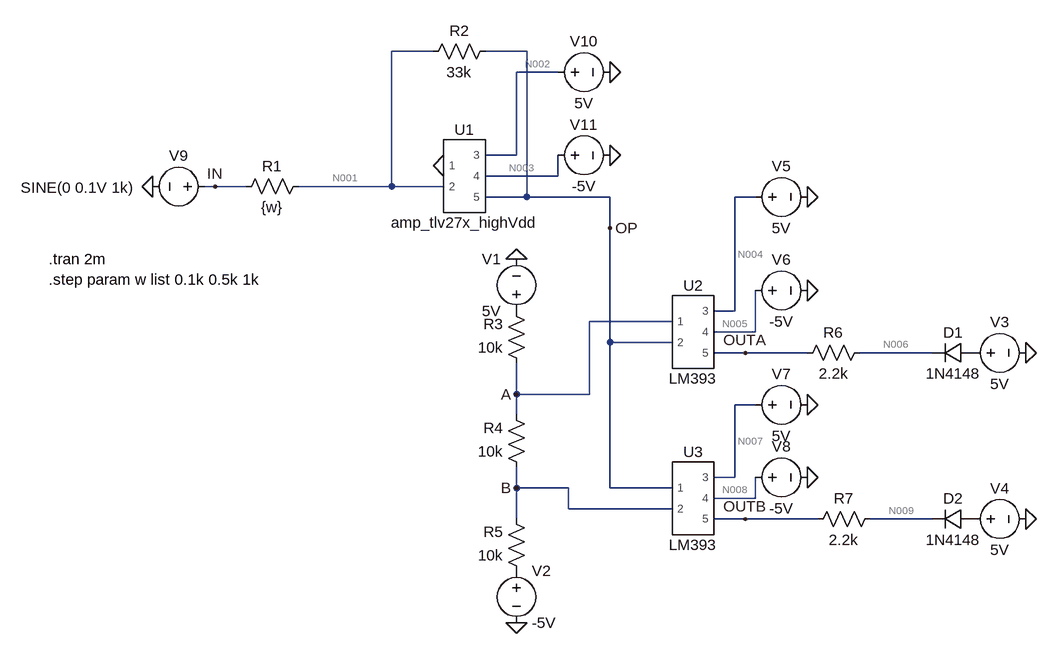
[diagram p0: schematic Example-7-8-a.asc]
Example-7-8-a.asc, the LTspice schematic file:
Version 4.1
SHEET 1 880 920
WIRE -64 0 -128 0
WIRE 80 0 16 0
WIRE 128 32 64 32
WIRE 64 160 64 32
WIRE 64 160 16 160
WIRE 128 192 128 160
WIRE 128 192 16 192
WIRE -400 208 -416 208
WIRE -352 208 -400 208
WIRE -128 208 -128 0
WIRE -128 208 -272 208
WIRE -48 208 -128 208
WIRE 80 224 80 0
WIRE 80 224 16 224
WIRE 208 224 80 224
WIRE 432 224 400 224
WIRE 208 272 208 224
WIRE 400 400 400 224
WIRE 400 400 368 400
WIRE 304 416 176 416
WIRE 432 432 432 368
WIRE 432 432 368 432
WIRE 208 448 208 272
WIRE 304 448 208 448
WIRE 416 464 368 464
WIRE 512 464 416 464
WIRE 704 464 592 464
WIRE 64 528 64 480
WIRE 176 528 176 416
WIRE 176 528 64 528
WIRE 432 544 400 544
WIRE 64 560 64 528
WIRE 400 656 400 544
WIRE 400 656 368 656
WIRE 64 672 64 640
WIRE 144 672 64 672
WIRE 208 672 208 448
WIRE 304 672 208 672
WIRE 432 688 432 656
WIRE 432 688 368 688
WIRE 144 704 144 672
WIRE 304 704 144 704
WIRE 64 720 64 672
WIRE 416 720 368 720
WIRE 528 720 416 720
WIRE 704 720 608 720
FLAG -48 176 0
FLAG 64 320 0
FLAG 512 224 0
FLAG 512 368 0
FLAG 64 880 0
FLAG 848 720 0
FLAG 848 464 0
FLAG -496 208 0
FLAG 512 544 0
FLAG 512 656 0
FLAG 208 32 0
FLAG 208 160 0
FLAG -400 208 IN
FLAG 64 528 A
FLAG 64 672 B
FLAG 416 464 OUTA
FLAG 416 720 OUTB
FLAG 208 272 OP
SYMBOL EEL3111C\\amp_tlv27x_highVdd -16 192 R0
SYMATTR InstName U1
SYMBOL EEL3111C\\LM393 336 432 R0
SYMATTR InstName U2
SYMBOL EEL3111C\\LM393 336 688 R0
SYMATTR InstName U3
SYMBOL res -256 192 R90
WINDOW 0 0 56 VBottom 2
WINDOW 3 32 56 VTop 2
SYMATTR InstName R1
SYMATTR Value {w}
SYMBOL res 32 -16 R90
WINDOW 0 0 56 VBottom 2
WINDOW 3 32 56 VTop 2
SYMATTR InstName R2
SYMATTR Value 33k
SYMBOL res 80 496 R180
WINDOW 0 36 76 Left 2
WINDOW 3 36 40 Left 2
SYMATTR InstName R3
SYMATTR Value 10k
SYMBOL res 80 656 R180
WINDOW 0 36 76 Left 2
WINDOW 3 36 40 Left 2
SYMATTR InstName R4
SYMATTR Value 10k
SYMBOL res 80 816 R180
WINDOW 0 36 76 Left 2
WINDOW 3 36 40 Left 2
SYMATTR InstName R5
SYMATTR Value 10k
SYMBOL voltage 64 416 R180
WINDOW 0 24 96 Left 2
WINDOW 3 24 16 Left 2
WINDOW 123 0 0 Left 0
WINDOW 39 0 0 Left 0
SYMATTR InstName V1
SYMATTR Value 5V
SYMBOL voltage 64 784 R0
WINDOW 123 0 0 Left 0
WINDOW 39 0 0 Left 0
SYMATTR InstName V2
SYMATTR Value -5V
SYMBOL res 608 448 R90
WINDOW 0 0 56 VBottom 2
WINDOW 3 32 56 VTop 2
SYMATTR InstName R6
SYMATTR Value 2.2k
SYMBOL res 624 704 R90
WINDOW 0 0 56 VBottom 2
WINDOW 3 32 56 VTop 2
SYMATTR InstName R7
SYMATTR Value 2.2k
SYMBOL diode 768 448 R90
WINDOW 0 0 32 VBottom 2
WINDOW 3 32 32 VTop 2
SYMATTR InstName D1
SYMATTR Value 1N4148
SYMBOL diode 768 704 R90
WINDOW 0 0 32 VBottom 2
WINDOW 3 32 32 VTop 2
SYMATTR InstName D2
SYMATTR Value 1N4148
SYMBOL voltage 752 464 R270
WINDOW 0 32 56 VTop 2
WINDOW 3 -32 56 VBottom 2
WINDOW 123 0 0 Left 0
WINDOW 39 0 0 Left 0
SYMATTR InstName V3
SYMATTR Value 5V
SYMBOL voltage 752 720 R270
WINDOW 0 32 56 VTop 2
WINDOW 3 -32 56 VBottom 2
WINDOW 123 0 0 Left 0
WINDOW 39 0 0 Left 0
SYMATTR InstName V4
SYMATTR Value 5V
SYMBOL voltage 416 224 R270
WINDOW 0 32 56 VTop 2
WINDOW 3 -32 56 VBottom 2
WINDOW 123 0 0 Left 0
WINDOW 39 0 0 Left 0
SYMATTR InstName V5
SYMATTR Value 5V
SYMBOL voltage 416 368 R270
WINDOW 0 32 56 VTop 2
WINDOW 3 -32 56 VBottom 2
WINDOW 123 0 0 Left 0
WINDOW 39 0 0 Left 0
SYMATTR InstName V6
SYMATTR Value -5V
SYMBOL voltage 416 544 R270
WINDOW 0 32 56 VTop 2
WINDOW 3 -32 56 VBottom 2
WINDOW 123 0 0 Left 0
WINDOW 39 0 0 Left 0
SYMATTR InstName V7
SYMATTR Value 5V
SYMBOL voltage 416 656 R270
WINDOW 0 32 56 VTop 2
WINDOW 3 -32 56 VBottom 2
WINDOW 123 0 0 Left 0
WINDOW 39 0 0 Left 0
SYMATTR InstName V8
SYMATTR Value -5V
SYMBOL voltage -400 208 R90
WINDOW 0 -32 56 VBottom 2
WINDOW 3 -14 212 VTop 2
WINDOW 123 0 0 Left 0
WINDOW 39 0 0 Left 0
SYMATTR InstName V9
SYMATTR Value SINE(0 0.1V 1k)
SYMBOL voltage 112 32 R270
WINDOW 0 32 56 VTop 2
WINDOW 3 -32 56 VBottom 2
WINDOW 123 0 0 Left 0
WINDOW 39 0 0 Left 0
SYMATTR InstName V10
SYMATTR Value 5V
SYMBOL voltage 112 160 R270
WINDOW 0 32 56 VTop 2
WINDOW 3 -32 56 VBottom 2
WINDOW 123 0 0 Left 0
WINDOW 39 0 0 Left 0
SYMATTR InstName V11
SYMATTR Value -5V
TEXT -656 320 Left 2 !.tran 2m\n.step param w list 0.1k 0.5k 1k

The netlist it stands for:
* Example-7-8-a.asc
X§U1 0 N001 N002 N003 OP amp_tlv27x_highVdd  ; pins 1 2 3 4 5
X§U2 A OP N004 N005 OUTA LM393  ; pins 1 2 3 4 5
X§U3 OP B N007 N008 OUTB LM393  ; pins 1 2 3 4 5
R1 N001 IN {w}
R2 OP N001 33k
R3 A P001 10k
R4 B A 10k
R5 P002 B 10k
V1 P001 0 5V
V2 P002 0 -5V
R6 N006 OUTA 2.2k
R7 N009 OUTB 2.2k
D1 P003 N006 1N4148
D2 P004 N009 1N4148
V3 P003 0 5V
V4 P004 0 5V
V5 N004 0 5V
V6 N005 0 -5V
V7 N007 0 5V
V8 N008 0 -5V
V9 IN 0 SINE(0 0.1V 1k)
V10 N002 0 5V
V11 N003 0 -5V
.model D D
.lib standard.dio
.tran 2m
.step param w list 0.1k 0.5k 1k
.lib TLV271.LIB
.lib LM393.5_1
.backanno
.end

* Results of the author's LTspice run, read from the files saved beside the schematic
* Operating Point (first step), zero values left out:
*   V(a) = 1.667 V
*   V(b) = -1.666 V
*   V(n001) = -278.2 µV
*   V(n002) = 5 V
*   V(n003) = -5 V
*   V(n004) = 5 V
*   V(n005) = -5 V
*   V(n006) = 5 V
*   V(n007) = 5 V
*   V(n008) = -5 V
*   V(n009) = 5 V
*   V(op) = -92.07 mV
*   V(outa) = 5 V
*   V(outb) = 5 V
*   V(p001) = 5 V
*   V(p002) = -5 V
*   V(p003) = 5 V
*   V(p004) = 5 V
*   I(D1) = 9.984 pA
*   I(D2) = 9.984 pA
*   I(R1) = -2.782 µA
*   I(R2) = -2.782 µA
*   I(R3) = -333.3 µA
*   I(R4) = -333.3 µA
*   I(R5) = -333.4 µA
*   I(R6) = 9.984 pA
*   I(R7) = 9.984 pA
*   I(V1) = -333.3 µA
*   I(V10) = -67.78 µA
*   I(V11) = 67.78 µA
*   I(V2) = 333.4 µA
*   I(V3) = -9.985 pA
*   I(V4) = -9.985 pA
*   I(V5) = -316 µA
*   I(V6) = 315.9 µA
*   I(V7) = -316 µA
*   I(V8) = 315.9 µA
*   I(V9) = -2.782 µA
*   Ix(u1:1) = -6.9 pA
*   Ix(u1:2) = -6.901 pA
*   Ix(u1:3) = 67.78 µA
*   Ix(u1:4) = -67.78 µA
*   Ix(u1:5) = 2.832 µA
*   Ix(u2:1) = 8.498 pA
*   Ix(u2:2) = -49.97 nA
*   Ix(u2:3) = 316 µA
*   Ix(u2:4) = -315.9 µA
*   Ix(u2:5) = 9.984 pA
*   Ix(u3:1) = 6.554 pA
*   Ix(u3:2) = -49.97 nA
*   Ix(u3:3) = 316 µA
*   Ix(u3:4) = -315.9 µA
*   Ix(u3:5) = 9.984 pA
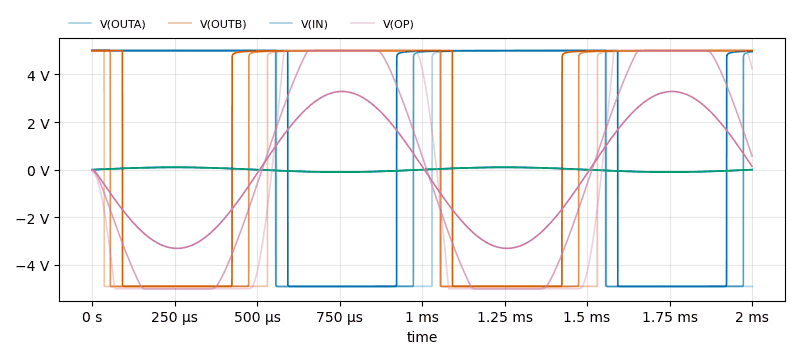
[diagram p1: Transient Analysis of Example-7-8-a.asc, plotted from the saved traces]
* Transient Analysis, 3 runs:
*   V(OUTA) [w=100]: min -4.902 V, max 5.003 V, average 475.4 mV, rms 4.952 V, last -4.902 V
*   V(OUTA) [w=500]: min -4.902 V, max 5.006 V, average 863.9 mV, rms 4.955 V, last 4.946 V
*   V(OUTA) [w=1000]: min -4.902 V, max 5.003 V, average 1.727 V, rms 4.962 V, last 4.979 V
*   V(OUTB) [w=100]: min -4.902 V, max 5.01 V, average 198.6 mV, rms 4.947 V, last 5 V
*   V(OUTB) [w=500]: min -4.902 V, max 5.002 V, average 841.7 mV, rms 4.953 V, last 5 V
*   V(OUTB) [w=1000]: min -4.902 V, max 5 V, average 1.705 V, rms 4.961 V, last 5 V
*   V(IN) [w=100]: min -100 mV, max 100 mV, average 0 V, rms 70.71 mV, last 0 V
*   V(IN) [w=500]: min -100 mV, max 100 mV, average 0 V, rms 70.71 mV, last 0 V
*   V(IN) [w=1000]: min -100 mV, max 100 mV, average 0 V, rms 70.71 mV, last 0 V
*   V(OP) [w=100]: min -5.001 V, max 5.001 V, average -111.7 mV, rms 4.702 V, last 4.252 V
*   V(OP) [w=500]: min -5.001 V, max 5.001 V, average -14.74 mV, rms 4.035 V, last 578.2 mV
*   V(OP) [w=1000]: min -3.303 V, max 3.284 V, average -10.1 mV, rms 2.329 V, last 142.8 mV